# Altium schematic sheet DC116A_ECG.SchDoc: ECG
size 431 x 279 mm; Date: Not shown in title block; ApprovedBy: Not shown in title block; CheckedBy: Not shown in title block; Author: Not shown in title block; CompanyName: Not shown in title block; DrawnBy: Midhun Raveendran; Engineer: Midhun Raveendran; Organization: Not shown in title block; Address1: Not shown in title block; Address2: Not shown in title block; Address3: Not shown in title block; Address4: Not shown in title block; DocumentNumber: 3; Revision: Use project parameter SCH_Rev; SheetNumber: 3; SheetTotal: 8; PageSetup: Record=PageOptions|CenterHorizontal=True|CenterVertical=True|PrintScale=1.00|XCorrection=1.00|YCorrection=1.00|PrintKind=0|BorderSize=5000000|LeftOffset=0|BottomOffset=0|Orientation=2|PaperLength=1000|PaperWidth=1000|Scale=100|PaperSource=15|PrintQuality=600|MediaType=1|DitherType=10|PaperKind=Letter|PrintScaleMode=1; CurrentTime: Not shown in title block; CurrentDate: Not shown in title block; Time: Not shown in title block; DocumentFullPathAndName: Not shown in title block; DocumentName: Not shown in title block; ModifiedDate: Not shown in title block; ImagePath: Not shown in title block
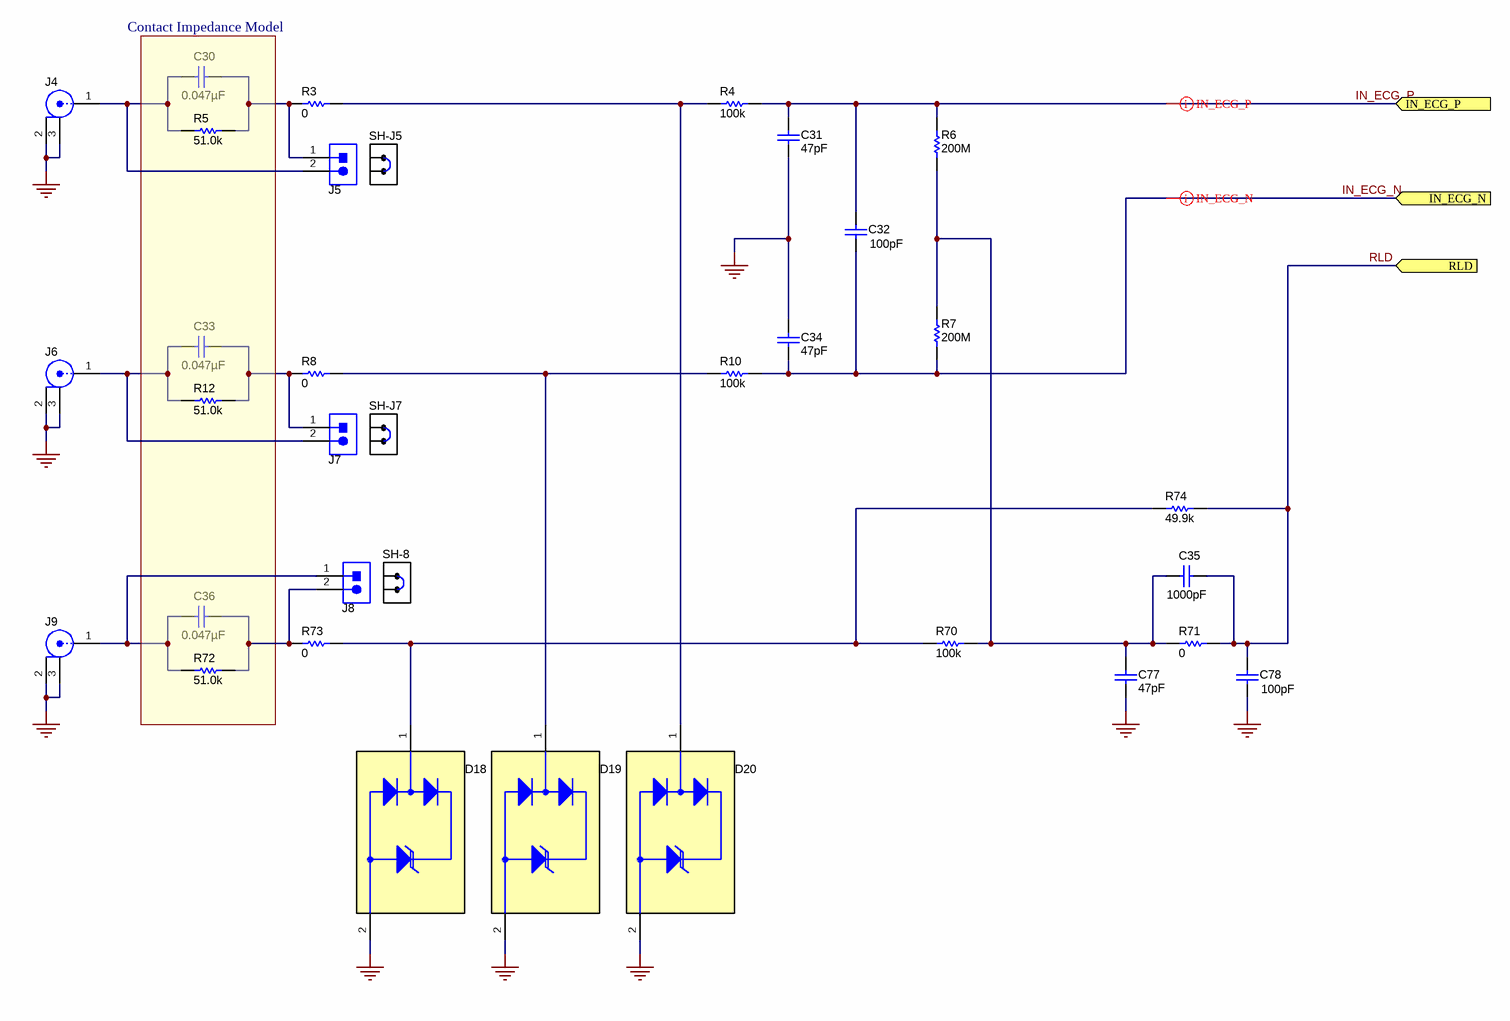
[diagram p0: DC116A_ECG.SchDoc]

## Parts
C30  ValueDisplayed: 0.047µF  [0201_033]  (hidden comment: C0603X5R1E473K030BB)
C31  ValueDisplayed: 47pF  [0201_033]  (hidden comment: GRM0335C1E470JA01D)
C32  ValueDisplayed: 100pF  [0201_033]  (hidden comment: C0603C0G1E101J030BA)
C33  ValueDisplayed: 0.047µF  [0201_033]  (hidden comment: C0603X5R1E473K030BB)
C34  ValueDisplayed: 47pF  [0201_033]  (hidden comment: GRM0335C1E470JA01D)
C35  ValueDisplayed: 1000pF  [0201_033]  (hidden comment: C0603X5R1E102K030BA)
C36  ValueDisplayed: 0.047µF  [0201_033]  (hidden comment: C0603X5R1E473K030BB)
C77  ValueDisplayed: 47pF  [0201_033]  (hidden comment: GRM0335C1E470JA01D)
C78  ValueDisplayed: 100pF  [0201_033]  (hidden comment: C0603C0G1E101J030BA)
D18  TPD1E04U04DPYR  [DPY0002A]  (value not drawn)
D19  TPD1E04U04DPYR  [DPY0002A]  (value not drawn)
D20  TPD1E04U04DPYR  [DPY0002A]  (value not drawn)
J4  41828  [PlasticsOne_41828]  (value not drawn)
J5  Header_2x1  [Samtec_TSW-102-07-T-S]  (value not drawn)
J6  41828  [PlasticsOne_41828]  (value not drawn)
J7  Header_2x1  [Samtec_TSW-102-07-T-S]  (value not drawn)
J8  Header_2x1  [Samtec_TSW-102-07-T-S]  (value not drawn)
J9  41828  [PlasticsOne_41828]  (value not drawn)
R3  ValueDisplayed: 0  [0201]  (hidden comment: CRCW02010000Z0ED)
R4  ValueDisplayed: 100k  [0201]  (hidden comment: RC0201DR-07100KL)
R5  ValueDisplayed: 51.0k  [0201]  (hidden comment: RC0201FR-0751KL)
R6  ValueDisplayed: 200M  [0603_HR]  (hidden comment: CRCW0603200MJPEAHR)
R7  ValueDisplayed: 200M  [0603_HR]  (hidden comment: CRCW0603200MJPEAHR)
R8  ValueDisplayed: 0  [0201]  (hidden comment: CRCW02010000Z0ED)
R10  ValueDisplayed: 100k  [0201]  (hidden comment: RC0201DR-07100KL)
R12  ValueDisplayed: 51.0k  [0201]  (hidden comment: RC0201FR-0751KL)
R70  ValueDisplayed: 100k  [0201]  (hidden comment: RC0201DR-07100KL)
R71  ValueDisplayed: 0  [0201]  (hidden comment: CRCW02010000Z0ED)
R72  ValueDisplayed: 51.0k  [0201]  (hidden comment: RC0201FR-0751KL)
R73  ValueDisplayed: 0  [0201]  (hidden comment: CRCW02010000Z0ED)
R74  ValueDisplayed: 49.9k  [0402]  (hidden comment: CRCW040249K9FKED)
SH-8  881545-2  [TE_881545-2]  (value not drawn)
SH-J5  881545-2  [TE_881545-2]  (value not drawn)
SH-J7  881545-2  [TE_881545-2]  (value not drawn)

## Ports
IN_ECG_N (in), IN_ECG_P (in), RLD (in)

## Nets
GND: C31.2 C34.2 C77.2 C78.2 D18.2(GND) D19.2(GND) D20.2(GND) J4.2 J4.3 J6.2 J6.3 J9.2 J9.3
IN_ECG_N: C32.2 C34.1 R7.1 R10.2 ; port IN_ECG_N
IN_ECG_P: C31.1 C32.1 R4.2 R6.2 ; port IN_ECG_P
RLD: C35.1 C78.1 R71.2 R74.2 ; port RLD
NetC30_1: C30.1 J5.1 R3.1 R5.2
NetC30_2: C30.2 J4.1 J5.2 R5.1
NetC33_1: C33.1 J7.1 R8.1 R12.2
NetC33_2: C33.2 J6.1 J7.2 R12.1
NetC35_2: C35.2 C77.1 R6.1 R7.2 R70.2 R71.1
NetC36_1: C36.1 J8.2 R72.2 R73.1
NetC36_2: C36.2 J8.1 J9.1 R72.1
NetD18_1: D18.1(I/O) R70.1 R73.2 R74.1
NetD19_1: D19.1(I/O) R8.2 R10.1
NetD20_1: D20.1(I/O) R3.2 R4.1

## Layout directives
differential pair: IN_ECG_N, IN_ECG_P

## Notes on the sheet
- (near C30) Contact Impedance Model
- Drawn By:
- SVN Rev:
- Number:
- TID #:
- Orderable:
- Rev:
- Sheet Title:
- File:
- Project Title:
- Designed for:
- Assembly Variant:
- Mod. Date:
- Sheet:
- Size:
- of
- B
- http://www.ti.com
- Texas Instruments and/or its licensors do not warrant the accuracy or completeness of this specification or any information contained therein. Texas Instruments and/or its licensors do not warrant that this design will meet the specifications, will be suitable for your application or fit for any particular purpose, or will operate in an implementation. Texas Instruments and/or its licensors do not warrant that the design is production worthy. You should completely validate and test your design implementation to confirm the system functionality for your application.
- Engineer:
- Contact:
- © Texas Instruments

## Library data of the parts
C30 C33 C36 = CMP-0081665-1: CAP, CERM, 0.047 µF, 25 V,+/- 10%, X5R, 0201; Manufacturer: TDK; Cap_F: 47nF; SizeAreaWB_mm2: 2.08; SizeArea_mm2: 0.18; AEC Qualified: N; AEC Category: Q200; Value: 0.047uF; TaMax_C: 85°C; SizeZ_mm: 0.33; TaMin_C: -55°C; VDC_V: 25V; SizeY_mm: 0.3; U/M: EA; SizeX_mm: 0.6; Cap_Case: 0201; ComponentLink1Description: Datasheet link; RoHS: Y; Tolerance_%: 10%; Supplier 1: Digi-Key; PackageReference: 0201; Technology: Ceramic; PartNumber: C0603X5R1E473K030BB; TempCo: X5R; Supplier Part Number 2: 810-C0603X5R1E473KBB; Supplier 2: Mouser; AEC Grade: N/A; Polarized: N; Value2: 25V; ComponentLink1URL: https://product.tdk.com/info/en/catalog/datasheets/mlcc_commercial_general_en.pdf; CompType: Capacitor; MountType: SMT; Supplier Part Number 1: 445-13679-1-ND
C31 C34 C77 = CMP-0009662-3: CAP, CERM, 47 pF, 25 V, +/- 5%, C0G/NP0, 0201; Manufacturer: MuRata; TaMin_C: -55°C; Polarized: N; SizeAreaWB_mm2: 2.08; Value1: Unknown; U/M: EA; Value: 47pF; TaMax_C: 125°C; SizeZ_mm: 0.33; SizeX_mm: 0.6; SizeY_mm: 0.3; Cap_Case: 0201; Value2: 25V; SizeArea_mm2: 0.18; AEC Category: Q200; Supplier Part Number 2: 80X8554; Publisher: Texas Instruments; Supplier 2: Newark; Supplier Part Number 3: 81-GRM0335C1E470JA1D; TempCo: C0G/NP0; Supplier 3: Mouser; Published: 2008-06-19; RoHS: Y; MountType: SMT; Supplier 1: Digi-Key; PackageReference: 0201; Tolerance_%: 5%; CompType: Capacitor; LatestRevisionDate: 2017-03-09; PartNumber: GRM0335C1E470JA01D; AEC Qualified: N; Cap_F: 47pF; VDC_V: 25V; ComponentLink1Description: Datasheet link; AEC Grade: N/A; Supplier Part Number 1: 490-1256-1-ND; Technology: Ceramic; ComponentLink1URL: http://search.murata.co.jp/Ceramy/image/img/A01X/G101/ENG/GRM0335C1E470JA01-01.pdf
C32 C78 = CMP-0009632-3: CAP, CERM, 100 pF, 25 V, +/- 5%, C0G/NP0, 0201; Manufacturer: TDK; TaMin_C: -55°C; Polarized: N; SizeAreaWB_mm2: 2.08; Value1: Unknown; U/M: EA; Value: 100pF; TaMax_C: 125°C; SizeZ_mm: 0.33; SizeX_mm: 0.6; SizeY_mm: 0.3; Cap_Case: 0201; Value2: 25V; SizeArea_mm2: 0.18; AEC Category: Q200; Supplier Part Number 2: 94W8063; Publisher: Texas Instruments; Supplier 2: Newark; Supplier Part Number 3: 1843157; TempCo: C0G/NP0; Supplier 3: Farnell; Published: 2008-06-19; RoHS: Y; MountType: SMT; Supplier 1: Digi-Key; PackageReference: 0201; Tolerance_%: 5%; CompType: Capacitor; LatestRevisionDate: 2017-03-09; PartNumber: C0603C0G1E101J030BA; AEC Qualified: N; Cap_F: 100pF; VDC_V: 25V; ComponentLink1Description: Datasheet link; AEC Grade: N/A; Supplier Part Number 1: 445-4675-1-ND; Technology: Ceramic; ComponentLink1URL: http://product.tdk.com/en/catalog/datasheets/mlcc_commercial_general_en.pdf
C35 = CMP-0009636-3: CAP, CERM, 1000 pF, 25 V, +/- 10%, X5R, 0201; Manufacturer: TDK; TaMin_C: -55°C; Polarized: N; SizeAreaWB_mm2: 2.08; Value1: Unknown; U/M: EA; Value: 1000pF; TaMax_C: 85°C; SizeZ_mm: 0.33; SizeX_mm: 0.6; SizeY_mm: 0.3; Cap_Case: 0201; Value2: 25V; SizeArea_mm2: 0.18; Cap_F: 1nF; AEC Category: Q200; Supplier Part Number 2: 91R0003; Publisher: Texas Instruments; Supplier 2: Newark; Supplier Part Number 3: 810-C0603X5R1E102K; TempCo: X5R; Supplier 3: Mouser; Published: 2008-06-19; RoHS: Y; MountType: SMT; Supplier 1: Digi-Key; PackageReference: 0201; Tolerance_%: 10%; CompType: Capacitor; LatestRevisionDate: 2017-03-09; PartNumber: C0603X5R1E102K030BA; AEC Qualified: N; VDC_V: 25V; ComponentLink1Description: Datasheet link; AEC Grade: N/A; Supplier Part Number 1: 445-1790-1-ND; Technology: Ceramic; ComponentLink1URL: https://product.tdk.com/info/en/documents/chara_sheet/C0603X5R1E102K030BA.pdf
D18-D20 = CMP-0073604-3: 1-Channel ESD Protection Diode With Low Dynamic Resistance for HDMI 2.0 and USB 3.0, DPY0002A (X1SON-2); Manufacturer: Texas Instruments; Alternate PartNumber: TPD1E04U04DPYT; SizeX_mm: 1.0; SizeAreaWB_mm2: 3.2; SizeArea_mm2: 0.6; CompType: IC; Rating: Catalog; AEC Category: Q200; SizeZ_mm: 0.45; MountType: SMT; PartNumber: TPD1E04U04DPYR; ComponentLink1URL: http://www.ti.com/lit/ds/symlink/tpd1e04u04.pdf; PackageDescription: X1SON-2; Operating Temperature Range: -40 to 125 C; SizeY_mm: 0.6; PackageReference: DPY0002A; Alternate Manufacturer: Texas Instruments; ComponentLink3Description: Online Datasheet; ComponentLink3URL: http://www.ti.com/product/tpd1e04u04/datasheet; ComponentLink2URL: http://www.ti.com/product/tpd1e04u04; ComponentLink1Description: Datasheet Link; ComponentLink2Description: Product Folder
J4 J6 J9 = CMP-0084074-1: Touchproof Jack, R/A, TH; Manufacturer: PlasticsOne; ContactFinish: Gold; Gender: Male; Current_A: 8A; Voltage_V: 1kV; PartNumber: 41828; PackageReference: Touchproof Jack, R/A, TH; CompType: JACK; Orientation: R/A; ComponentLink1Description: Datasheet URL; MountType: TH; ComponentLink1URL: http://www.plastics1.com/dash50/41828_dash50.pdf; PinCount: 3; Color: Black
J5 J7 J8 = CMP-0075508-2: Header, 2.54 mm, 2x1, Tin, TH; PartNumber: TSW-102-07-T-S; Manufacturer: Samtec; Pitch_mm: 2.54; Gender: Male; Shrouded: N; Row_Count: 1; Current_A: 6.3A; Voltage_V: 550V; Cert_CSA: Y; Green_Lifecycle: Active; Green_REACh: Passed; PackageReference: Header, 2.54 mm, 2x1, TH; ClassName: Header; CompType: Header; RoHS: Y; MountType: TH; ComponentLink1Description: Datasheet URL; ComponentLink1URL: http://www.samtec.com/documents/webfiles/pdf/TSW_TH.PDF; Supplier 1: Digi-Key; Supplier Part Number 1: SAM1035-02-ND; Supplier 2: Newark; Supplier Part Number 2: 12P1261; Supplier 3: Farnell; Supplier Part Number 3: 2035681; Orientation: Vertical; PinCount: 2; ContactFinish: Tin; Color: Black; Cert_UL: Y; Cert_CULUS: N; Cert_VDE: N; Green_EU RoHS-2: Passed; Green_EU RoHS: Passed
R3 R8 R71 R73 = CMP-0027008-4: RES, 0, 5%, 0.05 W, 0201; Manufacturer: Vishay-Dale; Power_W: 50mW; TempCo: ppm/C; Value_Code: 0000; Value: 0; EIA_Code: E24; SizeX_mm: 0.6; SizeY_mm: 0.3; SizeZ_mm: 0.26; Value2: 0.05W; SizeArea_mm2: 0.18; AEC Qualified: N; AEC Category: Q200; RoHS: E; Value1: 5%; MountType: SMT; Supplier 1: Newark; PackageReference: 0201; Tolerance_%: 5%; Res_ohm: 0; CompType: Resistor; PartNumber: CRCW02010000Z0ED; ComponentLink1Description: Datasheet link; AEC Grade: N/A; Supplier Part Number 1: 72M6743; Technology: Thick Film; ComponentLink1URL: http://www.vishay.com/docs/20052/crcw0201e3.pdf
R4 R10 R70 = CMP-0028132-1: RES, 100 k, 0.5%, 0.05 W, 0201; Manufacturer: Yageo America; Power_W: 50mW; TempCo: 200 ppm/C; U/M: EA; Value: 100k; EIA_Code: E192; SizeX_mm: 0.6; SizeY_mm: 0.3; SizeZ_mm: 0.26; Value2: 0.05W; SizeArea_mm2: 0.18; AEC Qualified: N; VDC_V: 25V; AEC Category: Q200; ComponentLink1URL: http://www.yageo.com/documents/recent/PYu-RC_Group_51_RoHS_L_5.pdf; Supplier Part Number 2: 603-RC0201DR-07100KL; Publisher: Texas Instruments; Supplier 2: Mouser; Published: 2016-10-14; Value_Code: 100k; RoHS: Y; Value1: 0.5%; MountType: SMT; Supplier 1: Digi-Key; PackageReference: 0201; Tolerance_%: 0.5%; Res_ohm: 100k; CompType: Resistor; LatestRevisionDate: 2017-03-09; PartNumber: RC0201DR-07100KL; ComponentLink1Description: Datasheet link; AEC Grade: N/A; Supplier Part Number 1: RC0201DR-07100KL-ND; Technology: Thick Film
R5 R12 R72 = CMP-0027757-1: RES, 51.0 k, 1%, 0.05 W, 0201; Manufacturer: Yageo America; Power_W: 50mW; TempCo: 200 ppm/C; Value_Code: 51k0; U/M: EA; Value: 51.0k; Res_ohm: 51k; SizeX_mm: 0.6; SizeY_mm: 0.3; SizeZ_mm: 0.26; Value2: 0.05W; SizeArea_mm2: 0.18; AEC Qualified: N; VDC_V: 25V; AEC Category: Q200; ComponentLink1URL: http://www.yageo.com/documents/recent/PYu-RC_Group_51_RoHS_L_5.pdf; Supplier Part Number 2: 603-RC0201FR-0751KL; Publisher: Texas Instruments; Supplier 2: Mouser; Published: 2016-10-14; RoHS: Y; Value1: 1%; MountType: SMT; Supplier 1: Digi-Key; PackageReference: 0201; Tolerance_%: 1%; CompType: Resistor; LatestRevisionDate: 2017-03-09; PartNumber: RC0201FR-0751KL; ComponentLink1Description: Datasheet link; AEC Grade: N/A; Supplier Part Number 1: 311-51.0KMCT-ND; Technology: Thick Film
R6 R7 = CMP-0025751-1: RES, 200 M, 5%, 0.1 W, 0603; Manufacturer: Vishay-Dale; Power_W: 100mW; TempCo: 500 ppm/C; U/M: EA; Value: 200Meg; SizeX_mm: 1.55; SizeY_mm: 0.85; SizeZ_mm: 0.5; Value2: 0.1W; SizeArea_mm2: 1.3175; AEC Qualified: N; VDC_V: 75V; AEC Category: Q200; ComponentLink1URL: http://www.vishay.com/docs/20022/dcrcwhe3.pdf; Supplier Part Number 2: 86R8508; Publisher: Texas Instruments; Supplier 2: Newark; Supplier Part Number 3: 71-CRCW0603200MJPEA; Supplier 3: Mouser; Published: 2008-06-26; Value_Code: 200M; RoHS: Y; Value1: 5%; MountType: SMT; Supplier 1: Digi-Key; PackageReference: 0603; Tolerance_%: 5%; Res_ohm: 200M; CompType: Resistor; LatestRevisionDate: 2017-03-09; PartNumber: CRCW0603200MJPEAHR; ComponentLink1Description: Datasheet link; AEC Grade: N/A; Supplier Part Number 1: 541-200MAHCT-ND; Technology: Thick Film
R74 = CMP-0026403-2: RES, 49.9 k, 1%, 0.063 W, AEC-Q200 Grade 0, 0402; Manufacturer: Vishay-Dale; Power_W: 63mW; TempCo: 100 ppm/C; Value_Code: 49k9; Value: 49.9k; EIA_Code: E96; SizeX_mm: 1; SizeY_mm: 0.5; SizeZ_mm: 0.6; Value2: 0.063W; AEC Qualified: Y; VDC_V: 50V; AEC Category: Q200; AEC Grade: 0; ComponentLink1URL: http://www.vishay.com/docs/20035/dcrcwe3.pdf; Supplier Part Number 2: 52K7113; Supplier 2: Newark; Supplier Part Number 3: 71-CRCW0402-49.9K-E3; Supplier 3: Mouser; RoHS: E; Value1: 1%; MountType: SMT; Supplier 1: Digi-Key; PackageReference: 0402; Tolerance_%: 1%; Res_ohm: 49.9k; SizeArea_mm2: 0.5; CompType: Resistor; PartNumber: CRCW040249K9FKED; ComponentLink1Description: Datasheet link; Supplier Part Number 1: 541-49.9KLCT-ND; Technology: Thick Film
SH-8 SH-J5 SH-J7 = CMP-0003677-2: Shunt, 100mil, Gold plated, Black; Manufacturer: TE Connectivity; CompType: Shunt; PartNumber: 881545-2; RoHS: Y; PackageReference: Shunt 2 pos. 100 mil; MountType: N/A; ComponentLink1Description: Datasheet Link; ComponentLink1URL: http://www.te.com/commerce/DocumentDelivery/DDEController?Action=srchrtrv&DocNm=881545&DocType=Customer+Drawing&DocLang=English; Publisher: Texas Instruments; LatestRevisionDate: 2017-03-09; Supplier 1: Digi-Key; Supplier Part Number 1: A26242-ND; Supplier 2: Newark; Supplier Part Number 2: 26H2523; Supplier 3: Mouser; Supplier Part Number 3: 571-8815452; Key: 881545-2